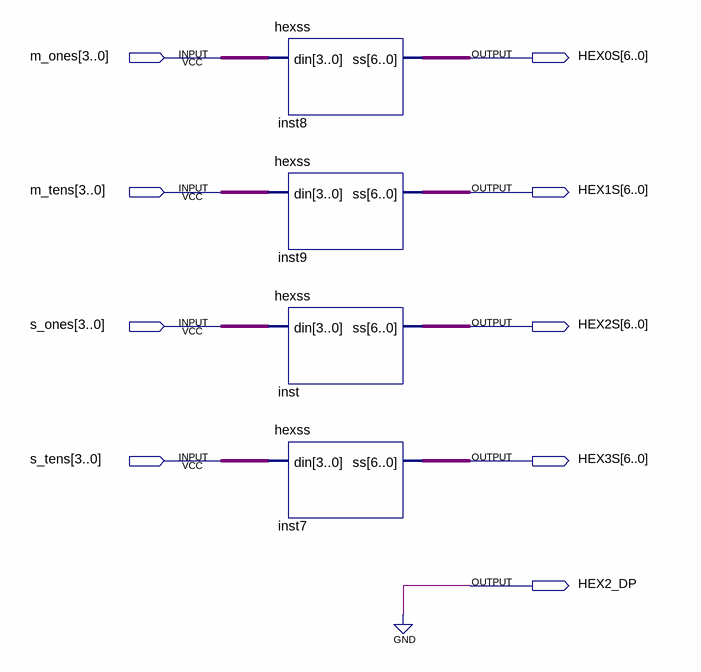
[diagram p0: schematic sheet]
// Quartus schematic SevenSegment.bdf as structural Verilog: 4 symbols, 9 pins
module SevenSegment (
  input  [3:0] m_ones,
  input  [3:0] m_tens,
  input  [3:0] s_ones,
  input  [3:0] s_tens,
  output [6:0] HEX0S,
  output [6:0] HEX1S,
  output [6:0] HEX2S,
  output [6:0] HEX3S,
  output HEX2_DP
);

  hexss inst8 (.din(m_ones), .ss(HEX0S));
  hexss inst9 (.din(m_tens), .ss(HEX1S));
  hexss inst (.din(s_ones), .ss(HEX2S));
  hexss inst7 (.din(s_tens), .ss(HEX3S));

  assign HEX2_DP = 1'b0;
endmodule
